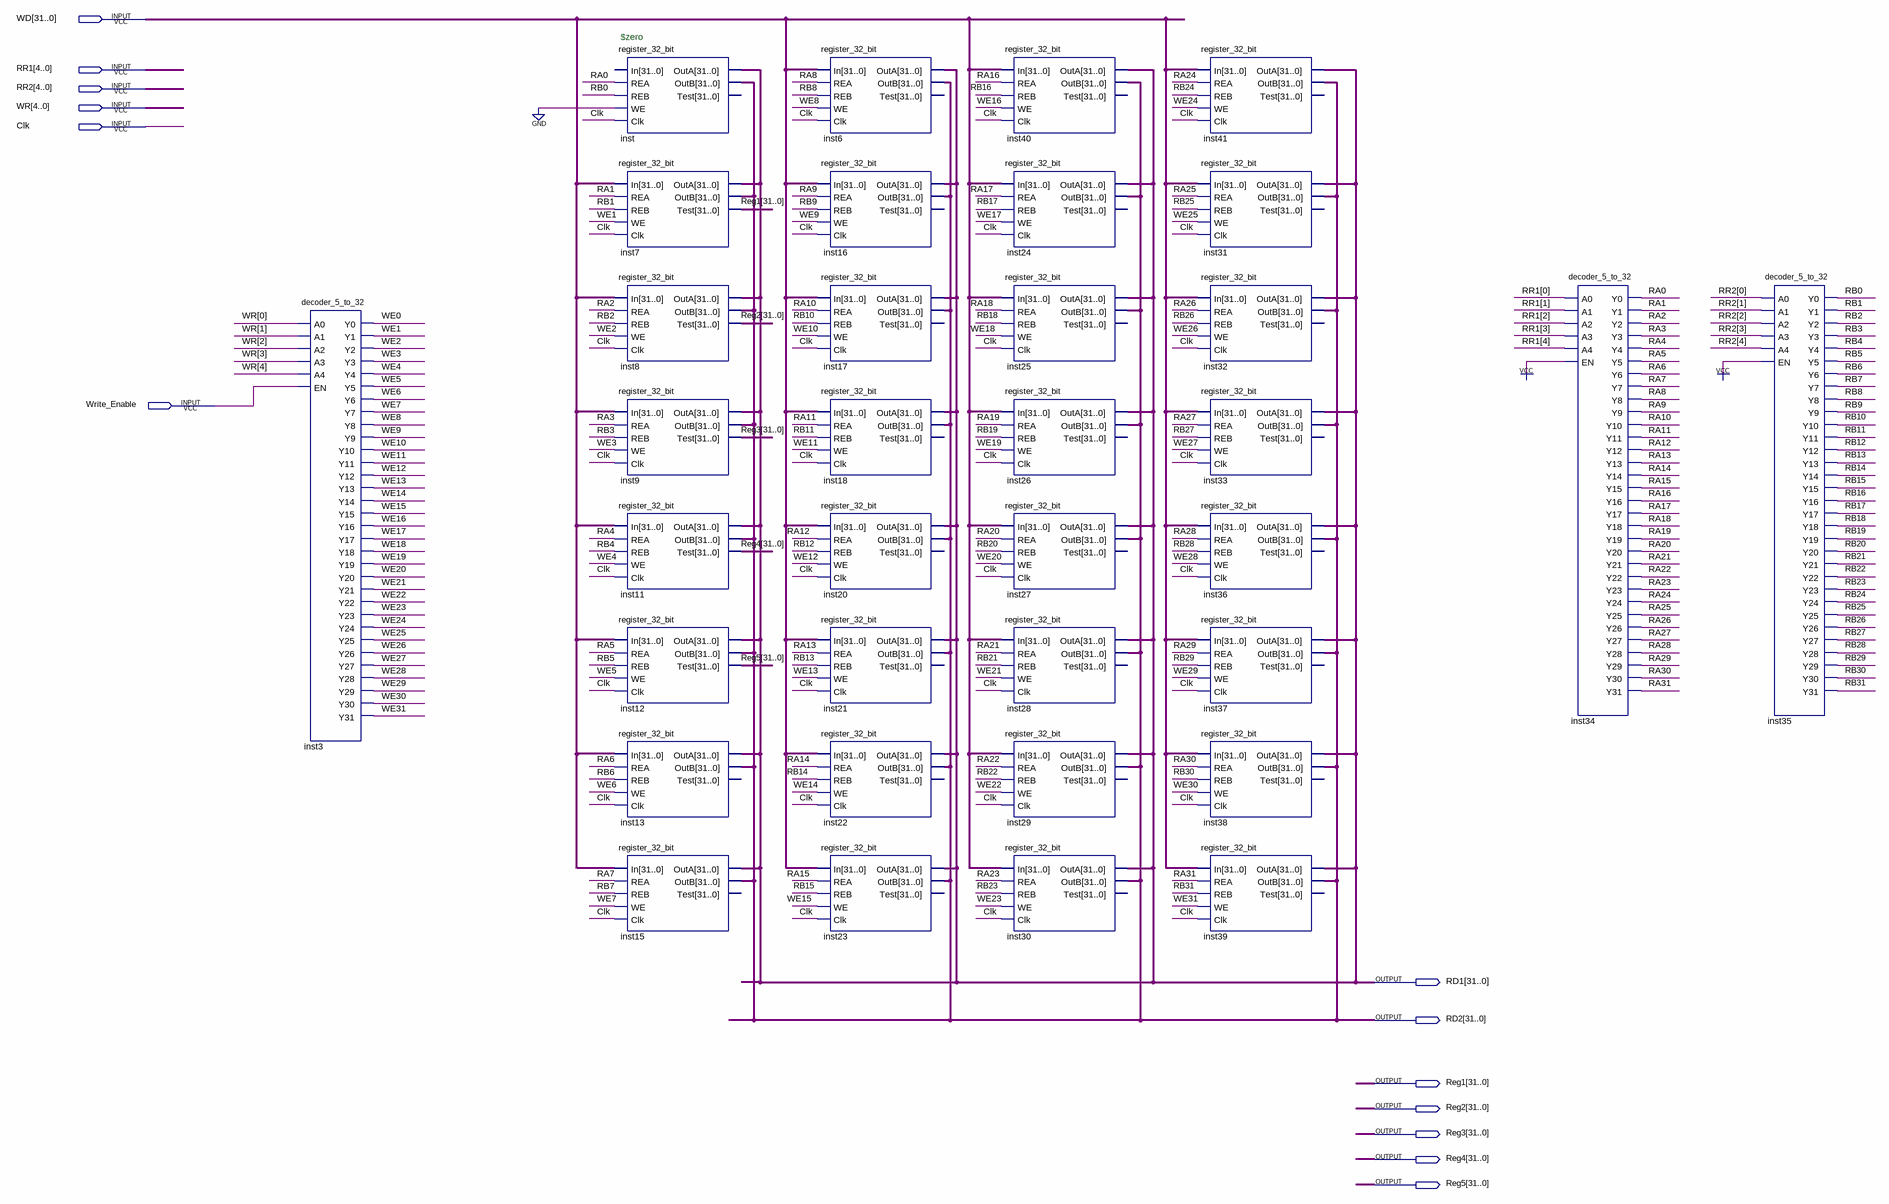
[diagram p0: schematic sheet]
// Quartus schematic register_file.bdf as structural Verilog: 35 symbols, 13 pins
module register_file (
  input  [31:0] WD,
  input  [4:0] RR1,
  input  [4:0] RR2,
  input  [4:0] WR,
  input  Clk,
  input  Write_Enable,
  output [31:0] RD1,
  output [31:0] RD2,
  output [31:0] Reg1,
  output [31:0] Reg2,
  output [31:0] Reg3,
  output [31:0] Reg4,
  output [31:0] Reg5
);

  wire RA0, RA1, RA2, RA3, RA4, RA5, RA6, RA7, RA8, RA9, RA10, RA11, RA12, RA13, RA14, RA15, RA16, RA17,
       RA18, RA19, RA20, RA21, RA22, RA23, RA24, RA25, RA26, RA27, RA28, RA29, RA30, RA31, RB0, RB1, RB2,
       RB3, RB4, RB5, RB6, RB7, RB8, RB9, RB10, RB11, RB12, RB13, RB14, RB15, RB16, RB17, RB18, RB19, RB20,
       RB21, RB22, RB23, RB24, RB25, RB26, RB27, RB28, RB29, RB30, RB31, WE0, WE1, WE2, WE3, WE4, WE5, WE6,
       WE7, WE8, WE9, WE10, WE11, WE12, WE13, WE14, WE15, WE16, WE17, WE18, WE19, WE20, WE21, WE22, WE23,
       WE24, WE25, WE26, WE27, WE28, WE29, WE30, WE31;

  decoder_5_to_32 inst3 (
    .A0(WR[0]), .A1(WR[1]), .A2(WR[2]), .A3(WR[3]), .A4(WR[4]), .EN(Write_Enable), .Y0(WE0), .Y1(WE1),
    .Y2(WE2), .Y3(WE3), .Y4(WE4), .Y5(WE5), .Y6(WE6), .Y7(WE7), .Y8(WE8), .Y9(WE9), .Y10(WE10), .Y11(WE11),
    .Y12(WE12), .Y13(WE13), .Y14(WE14), .Y15(WE15), .Y16(WE16), .Y17(WE17), .Y18(WE18), .Y19(WE19),
    .Y20(WE20), .Y21(WE21), .Y22(WE22), .Y23(WE23), .Y24(WE24), .Y25(WE25), .Y26(WE26), .Y27(WE27),
    .Y28(WE28), .Y29(WE29), .Y30(WE30), .Y31(WE31));
  register_32_bit inst (.REA(RA0), .REB(RB0), .WE(1'b0), .Clk(Clk), .OutA(RD1), .OutB(RD2));  // open: In, Test
  register_32_bit inst7 (.In(WD), .REA(RA1), .REB(RB1), .WE(WE1), .Clk(Clk), .OutA(RD1), .OutB(RD2), .Test(Reg1));
  register_32_bit inst8 (.In(WD), .REA(RA2), .REB(RB2), .WE(WE2), .Clk(Clk), .OutA(RD1), .OutB(RD2), .Test(Reg2));
  register_32_bit inst9 (.In(WD), .REA(RA3), .REB(RB3), .WE(WE3), .Clk(Clk), .OutA(RD1), .OutB(RD2), .Test(Reg3));
  register_32_bit inst11 (.In(WD), .REA(RA4), .REB(RB4), .WE(WE4), .Clk(Clk), .OutA(RD1), .OutB(RD2), .Test(Reg4));
  register_32_bit inst12 (.In(WD), .REA(RA5), .REB(RB5), .WE(WE5), .Clk(Clk), .OutA(RD1), .OutB(RD2), .Test(Reg5));
  register_32_bit inst13 (.In(WD), .REA(RA6), .REB(RB6), .WE(WE6), .Clk(Clk), .OutA(RD1), .OutB(RD2));  // open: Test
  register_32_bit inst15 (.In(WD), .REA(RA7), .REB(RB7), .WE(WE7), .Clk(Clk), .OutA(RD1), .OutB(RD2));  // open: Test
  register_32_bit inst6 (.In(WD), .REA(RA8), .REB(RB8), .WE(WE8), .Clk(Clk), .OutA(RD1), .OutB(RD2));  // open: Test
  register_32_bit inst16 (.In(WD), .REA(RA9), .REB(RB9), .WE(WE9), .Clk(Clk), .OutA(RD1), .OutB(RD2));  // open: Test
  register_32_bit inst17 (.In(WD), .REA(RA10), .REB(RB10), .WE(WE10), .Clk(Clk), .OutA(RD1), .OutB(RD2));  // open: Test
  register_32_bit inst18 (.In(WD), .REA(RA11), .REB(RB11), .WE(WE11), .Clk(Clk), .OutA(RD1), .OutB(RD2));  // open: Test
  register_32_bit inst20 (.In(WD), .REA(RA12), .REB(RB12), .WE(WE12), .Clk(Clk), .OutA(RD1), .OutB(RD2));  // open: Test
  register_32_bit inst21 (.In(WD), .REA(RA13), .REB(RB13), .WE(WE13), .Clk(Clk), .OutA(RD1), .OutB(RD2));  // open: Test
  register_32_bit inst22 (.In(WD), .REA(RA14), .REB(RB14), .WE(WE14), .Clk(Clk), .OutA(RD1), .OutB(RD2));  // open: Test
  register_32_bit inst23 (.In(WD), .REA(RA15), .REB(RB15), .WE(WE15), .Clk(Clk), .OutA(RD1), .OutB(RD2));  // open: Test
  register_32_bit inst40 (.In(WD), .REA(RA16), .REB(RB16), .WE(WE16), .Clk(Clk), .OutA(RD1), .OutB(RD2));  // open: Test
  register_32_bit inst24 (.In(WD), .REA(RA17), .REB(RB17), .WE(WE17), .Clk(Clk), .OutA(RD1), .OutB(RD2));  // open: Test
  register_32_bit inst25 (.In(WD), .REA(RA18), .REB(RB18), .WE(WE18), .Clk(Clk), .OutA(RD1), .OutB(RD2));  // open: Test
  register_32_bit inst26 (.In(WD), .REA(RA19), .REB(RB19), .WE(WE19), .Clk(Clk), .OutA(RD1), .OutB(RD2));  // open: Test
  register_32_bit inst27 (.In(WD), .REA(RA20), .REB(RB20), .WE(WE20), .Clk(Clk), .OutA(RD1), .OutB(RD2));  // open: Test
  register_32_bit inst28 (.In(WD), .REA(RA21), .REB(RB21), .WE(WE21), .Clk(Clk), .OutA(RD1), .OutB(RD2));  // open: Test
  register_32_bit inst29 (.In(WD), .REA(RA22), .REB(RB22), .WE(WE22), .Clk(Clk), .OutA(RD1), .OutB(RD2));  // open: Test
  register_32_bit inst30 (.In(WD), .REA(RA23), .REB(RB23), .WE(WE23), .Clk(Clk), .OutA(RD1), .OutB(RD2));  // open: Test
  register_32_bit inst41 (.In(WD), .REA(RA24), .REB(RB24), .WE(WE24), .Clk(Clk), .OutA(RD1), .OutB(RD2));  // open: Test
  register_32_bit inst31 (.In(WD), .REA(RA25), .REB(RB25), .WE(WE25), .Clk(Clk), .OutA(RD1), .OutB(RD2));  // open: Test
  register_32_bit inst32 (.In(WD), .REA(RA26), .REB(RB26), .WE(WE26), .Clk(Clk), .OutA(RD1), .OutB(RD2));  // open: Test
  register_32_bit inst33 (.In(WD), .REA(RA27), .REB(RB27), .WE(WE27), .Clk(Clk), .OutA(RD1), .OutB(RD2));  // open: Test
  register_32_bit inst36 (.In(WD), .REA(RA28), .REB(RB28), .WE(WE28), .Clk(Clk), .OutA(RD1), .OutB(RD2));  // open: Test
  register_32_bit inst37 (.In(WD), .REA(RA29), .REB(RB29), .WE(WE29), .Clk(Clk), .OutA(RD1), .OutB(RD2));  // open: Test
  register_32_bit inst38 (.In(WD), .REA(RA30), .REB(RB30), .WE(WE30), .Clk(Clk), .OutA(RD1), .OutB(RD2));  // open: Test
  register_32_bit inst39 (.In(WD), .REA(RA31), .REB(RB31), .WE(WE31), .Clk(Clk), .OutA(RD1), .OutB(RD2));  // open: Test
  decoder_5_to_32 inst34 (
    .A0(RR1[0]), .A1(RR1[1]), .A2(RR1[2]), .A3(RR1[3]), .A4(RR1[4]), .EN(1'b1), .Y0(RA0), .Y1(RA1), .Y2(RA2),
    .Y3(RA3), .Y4(RA4), .Y5(RA5), .Y6(RA6), .Y7(RA7), .Y8(RA8), .Y9(RA9), .Y10(RA10), .Y11(RA11), .Y12(RA12),
    .Y13(RA13), .Y14(RA14), .Y15(RA15), .Y16(RA16), .Y17(RA17), .Y18(RA18), .Y19(RA19), .Y20(RA20),
    .Y21(RA21), .Y22(RA22), .Y23(RA23), .Y24(RA24), .Y25(RA25), .Y26(RA26), .Y27(RA27), .Y28(RA28),
    .Y29(RA29), .Y30(RA30), .Y31(RA31));
  decoder_5_to_32 inst35 (
    .A0(RR2[0]), .A1(RR2[1]), .A2(RR2[2]), .A3(RR2[3]), .A4(RR2[4]), .EN(1'b1), .Y0(RB0), .Y1(RB1), .Y2(RB2),
    .Y3(RB3), .Y4(RB4), .Y5(RB5), .Y6(RB6), .Y7(RB7), .Y8(RB8), .Y9(RB9), .Y10(RB10), .Y11(RB11), .Y12(RB12),
    .Y13(RB13), .Y14(RB14), .Y15(RB15), .Y16(RB16), .Y17(RB17), .Y18(RB18), .Y19(RB19), .Y20(RB20),
    .Y21(RB21), .Y22(RB22), .Y23(RB23), .Y24(RB24), .Y25(RB25), .Y26(RB26), .Y27(RB27), .Y28(RB28),
    .Y29(RB29), .Y30(RB30), .Y31(RB31));

  // Notes on the sheet:
  //   $zero
endmodule
